# Altium schematic sheet RFID.SchDoc
size A4; SheetNumber: 8; SheetTotal: 9
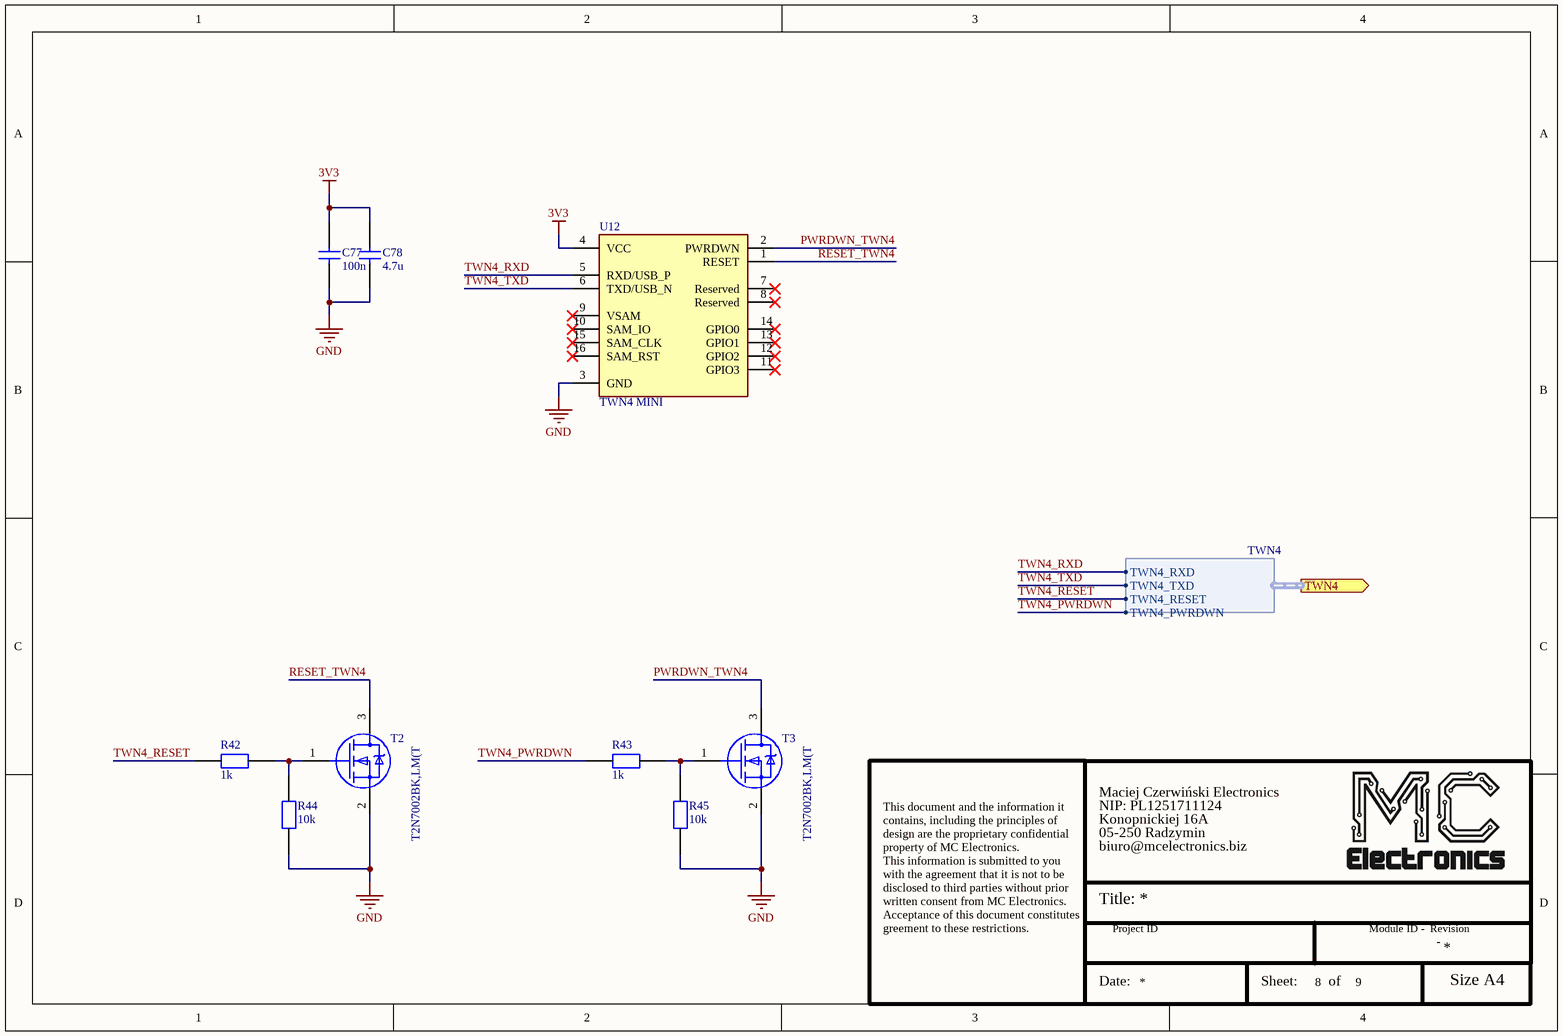
[diagram p0: RFID.SchDoc]

## Parts
C77  value 100n  [0603C]  (hidden comment: 100nF 50V X7R 10%)
C78  value 4.7u  [0603C]  (hidden comment: 4.7uF 16V X5R 10%)
R42  value 1k  [0603R]  (hidden comment: 1k 1% 0.1W)
R43  value 1k  [0603R]  (hidden comment: 1k 1% 0.1W)
R44  value 10k  [0603R]  (hidden comment: 10k 1% 0.1W)
R45  value 10k  [0603R]  (hidden comment: 10k 1% 0.1W)
T2  T2N7002BK,LM(T  [SOT95P235X110-3N]
T3  T2N7002BK,LM(T  [SOT95P235X110-3N]
U12  TWN4 MINI  [TWN4 MULTITECH HF MINI READER]

## Ports
TWN4 (out, harness TWN4)

## Harnesses
TWN4: TWN4_RXD, TWN4_TXD, TWN4_RESET, TWN4_PWRDWN

## Nets
3V3: C77.2 C78.2 U12.4(VCC)
GND: C77.1 C78.1 R44.2 R45.2 T2.2(E) T3.2(E) U12.3(GND)
PWRDWN_TWN4: T3.3(C) U12.2(PWRDWN)
RESET_TWN4: T2.3(C) U12.1(RESET)
TWN4_PWRDWN: R43.2 ; port TWN4.TWN4_PWRDWN
TWN4_RESET: R42.2 ; port TWN4.TWN4_RESET
TWN4_RXD: U12.5(RXD/USB_P) ; port TWN4.TWN4_RXD
TWN4_TXD: U12.6(TXD/USB_N) ; port TWN4.TWN4_TXD
NetR42_1: R42.1 R44.1 T2.1(B)
NetR43_1: R43.1 R45.1 T3.1(B)

Not connected (* = marked no-connect by the designer): U12 7(Reserved)* 8(Reserved)* 9(VSAM)* 10(SAM_IO)* 11(GPIO3)* 12(GPIO2)* 13(GPIO1)* 14(GPIO0)* 15(SAM_CLK)* 16(SAM_RST)*

## Notes on the sheet
- This document and the information it
- contains, including the principles of
- design are the proprietary confidential
- property of MC Electronics.
- Maciej Czerwiński Electronics
- NIP: PL1251711124
- Konopnickiej 16A
- 05-250 Radzymin
- biuro@mcelectronics.biz
- This information is submitted to you
- with the agreement that it is not to be
- disclosed to third parties without prior
- written consent from MC Electronics.
- Acceptance of this document constitutes
- Title:
- greement to these restrictions.
- Date:
- Project ID
- Sheet:
- of
- Module ID -
- Revision
- -
- Size A4

## Library data of the parts
C77 = GEN_100nF_50V_X7R_10%_0603: Generic capacitor 100n 0603; MC_ID: C00001; Generic: Yes; Mount type: SMT
C78 = GEN_4.7uF_16V_X5R_10%_0603: Generic capacitor 4.7u 0603; MC_ID: C00066; Generic: Yes; Mount type: SMT
R42 R43 = GEN_1k_1%_0.1W_0603: Generic resistor 1k 0603; Generic: Yes; MC_ID: R00027; Mount type: SMT
R44 R45 = GEN_10k_1%_0.1W_0603: Generic resistor 10k 0603; MC_ID: R00003; Generic: Yes; Mount type: SMT
T2 T3 = T2N7002BK,LM(T: T2N7002BK,LM(T N-MOSFET 60V 0,4A GSD SOT23; Generic: No; MC_ID: TPO00095; Mount type: SMT; Specific PN: T2N7002BK,LM(T
U12 = TWN4 MINI: TWN4 MULTITECH HF MINI READER; MC_ID: x; Generic: No; Specific PN: TWN4 MULTITECH HF MINI READER; Mount type: SMT